# Altium project FPGA_Modular_DevBoard.PrjPcb (part 2 of 2)

## Sheet seven_segment_displays.SchDoc
size A3; SheetNumber: 12; SheetTotal: 18; SPICEModelCacheAGOJJZQO: <root> / <DocumentId>AGOJJZQO</DocumentId> / </root>
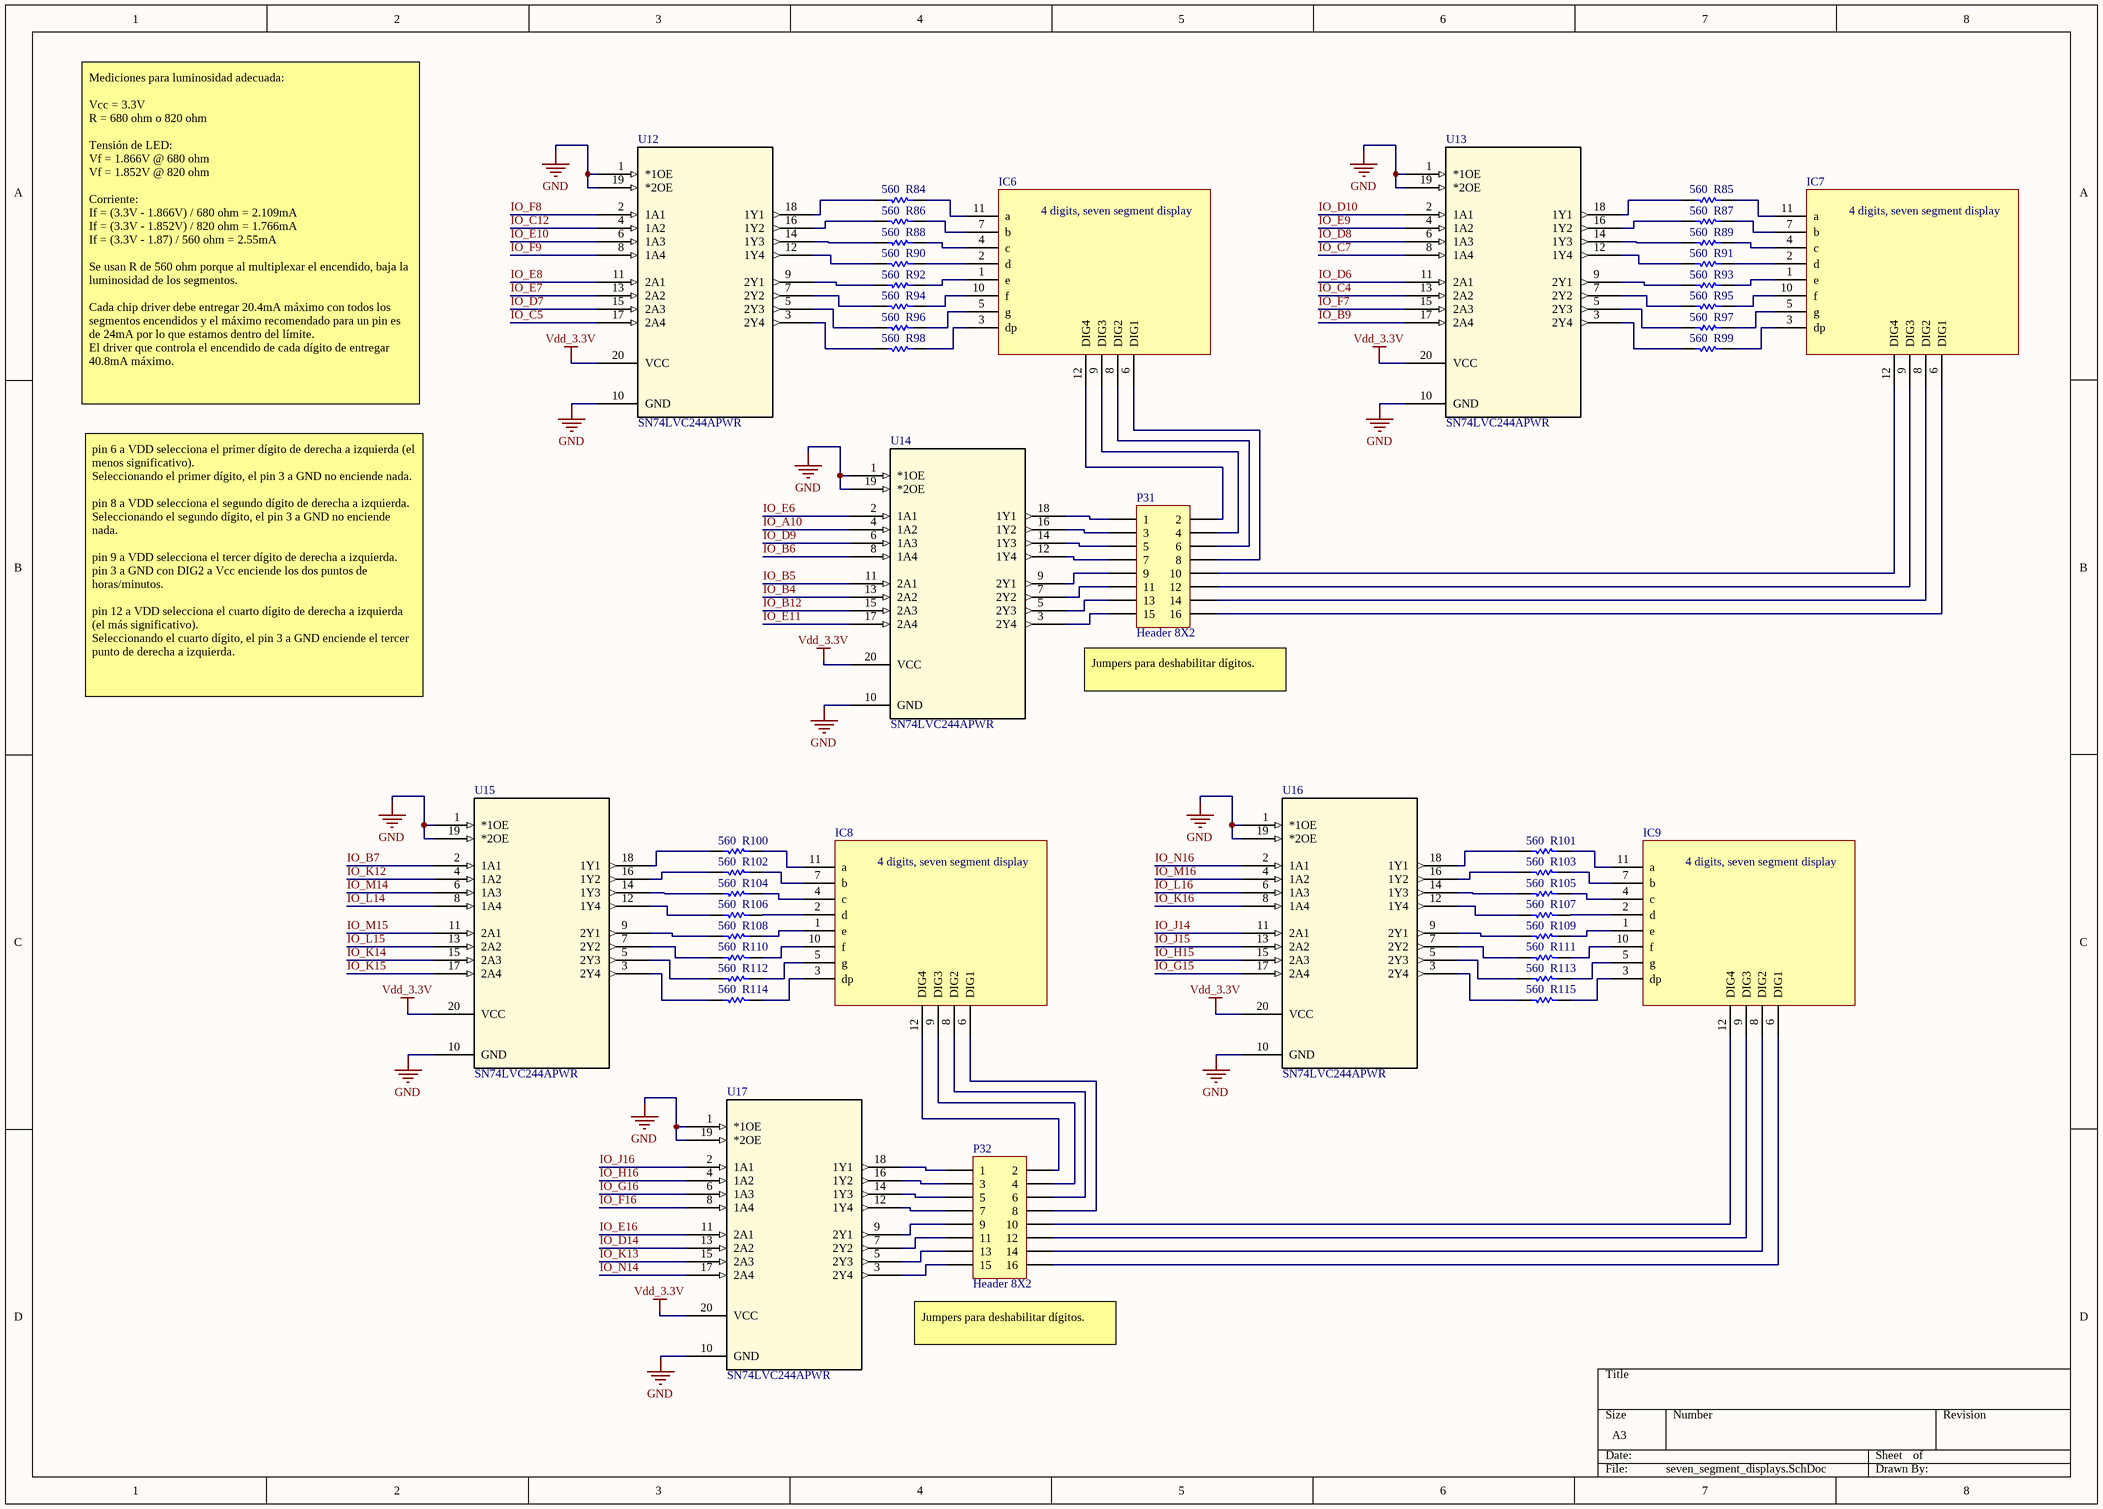
[diagram p14: seven_segment_displays.SchDoc]

### Parts
IC6  Seven segment display x 4 digits  [4 digit, seven segment display / 50.3mm x 19mm]  (value not drawn)
IC7  Seven segment display x 4 digits  [4 digit, seven segment display / 50.3mm x 19mm]  (value not drawn)
IC8  Seven segment display x 4 digits  [4 digit, seven segment display / 50.3mm x 19mm]  (value not drawn)
IC9  Seven segment display x 4 digits  [4 digit, seven segment display / 50.3mm x 19mm]  (value not drawn)
P31  Header 8X2  [HDR2X8]
P32  Header 8X2  [HDR2X8]
R84  value 560  [resistor 0603]  (hidden comment: resistor)
R85  value 560  [resistor 0603]  (hidden comment: resistor)
R86  value 560  [resistor 0603]  (hidden comment: resistor)
R87  value 560  [resistor 0603]  (hidden comment: resistor)
R88  value 560  [resistor 0603]  (hidden comment: resistor)
R89  value 560  [resistor 0603]  (hidden comment: resistor)
R90  value 560  [resistor 0603]  (hidden comment: resistor)
R91  value 560  [resistor 0603]  (hidden comment: resistor)
R92  value 560  [resistor 0603]  (hidden comment: resistor)
R93  value 560  [resistor 0603]  (hidden comment: resistor)
R94  value 560  [resistor 0603]  (hidden comment: resistor)
R95  value 560  [resistor 0603]  (hidden comment: resistor)
R96  value 560  [resistor 0603]  (hidden comment: resistor)
R97  value 560  [resistor 0603]  (hidden comment: resistor)
R98  value 560  [resistor 0603]  (hidden comment: resistor)
R99  value 560  [resistor 0603]  (hidden comment: resistor)
R100  value 560  [resistor 0603]  (hidden comment: resistor)
R101  value 560  [resistor 0603]  (hidden comment: resistor)
R102  value 560  [resistor 0603]  (hidden comment: resistor)
R103  value 560  [resistor 0603]  (hidden comment: resistor)
R104  value 560  [resistor 0603]  (hidden comment: resistor)
R105  value 560  [resistor 0603]  (hidden comment: resistor)
R106  value 560  [resistor 0603]  (hidden comment: resistor)
R107  value 560  [resistor 0603]  (hidden comment: resistor)
R108  value 560  [resistor 0603]  (hidden comment: resistor)
R109  value 560  [resistor 0603]  (hidden comment: resistor)
R110  value 560  [resistor 0603]  (hidden comment: resistor)
R111  value 560  [resistor 0603]  (hidden comment: resistor)
R112  value 560  [resistor 0603]  (hidden comment: resistor)
R113  value 560  [resistor 0603]  (hidden comment: resistor)
R114  value 560  [resistor 0603]  (hidden comment: resistor)
R115  value 560  [resistor 0603]  (hidden comment: resistor)
U12  SN74LVC244APWR  [PW20]
U13  SN74LVC244APWR  [PW20]
U14  SN74LVC244APWR  [PW20]
U15  SN74LVC244APWR  [PW20]
U16  SN74LVC244APWR  [PW20]
U17  SN74LVC244APWR  [PW20]

### Nets
GND: U12.1(*1OE) U12.10(GND) U12.19(*2OE) U13.1(*1OE) U13.10(GND) U13.19(*2OE) U14.1(*1OE) U14.10(GND) U14.19(*2OE) U15.1(*1OE) U15.10(GND) U15.19(*2OE) U16.1(*1OE) U16.10(GND) U16.19(*2OE) U17.1(*1OE) U17.10(GND) U17.19(*2OE)
Vdd_3.3V: U12.20(VCC) U13.20(VCC) U14.20(VCC) U15.20(VCC) U16.20(VCC) U17.20(VCC)
IO_A10: U14.4(1A2)
IO_B4: U14.13(2A2)
IO_B5: U14.11(2A1)
IO_B6: U14.8(1A4)
IO_B7: U15.2(1A1)
IO_B9: U13.17(2A4)
IO_B12: U14.15(2A3)
IO_C4: U13.13(2A2)
IO_C5: U12.17(2A4)
IO_C7: U13.8(1A4)
IO_C12: U12.4(1A2)
IO_D6: U13.11(2A1)
IO_D7: U12.15(2A3)
IO_D8: U13.6(1A3)
IO_D9: U14.6(1A3)
IO_D10: U13.2(1A1)
IO_D14: U17.13(2A2)
IO_E6: U14.2(1A1)
IO_E7: U12.13(2A2)
IO_E8: U12.11(2A1)
IO_E9: U13.4(1A2)
IO_E10: U12.6(1A3)
IO_E11: U14.17(2A4)
IO_E16: U17.11(2A1)
IO_F7: U13.15(2A3)
IO_F8: U12.2(1A1)
IO_F9: U12.8(1A4)
IO_F16: U17.8(1A4)
IO_G15: U16.17(2A4)
IO_G16: U17.6(1A3)
IO_H15: U16.15(2A3)
IO_H16: U17.4(1A2)
IO_J14: U16.11(2A1)
IO_J15: U16.13(2A2)
IO_J16: U17.2(1A1)
IO_K12: U15.4(1A2)
IO_K13: U17.15(2A3)
IO_K14: U15.15(2A3)
IO_K15: U15.17(2A4)
IO_K16: U16.8(1A4)
IO_L14: U15.8(1A4)
IO_L15: U15.13(2A2)
IO_L16: U16.6(1A3)
IO_M14: U15.6(1A3)
IO_M15: U15.11(2A1)
IO_M16: U16.4(1A2)
IO_N14: U17.17(2A4)
IO_N16: U16.2(1A1)
NetIC6_1: IC6.1(e) R92.2
NetIC6_2: IC6.2(d) R90.2
NetIC6_3: IC6.3(dp) R98.2
NetIC6_4: IC6.4(c) R88.2
NetIC6_5: IC6.5(g) R96.2
NetIC6_6: IC6.6(DIG1) P31.8
NetIC6_7: IC6.7(b) R86.2
NetIC6_8: IC6.8(DIG2) P31.6
NetIC6_9: IC6.9(DIG3) P31.4
NetIC6_10: IC6.10(f) R94.2
NetIC6_11: IC6.11(a) R84.2
NetIC6_12: IC6.12(DIG4) P31.2
NetIC7_1: IC7.1(e) R93.2
NetIC7_2: IC7.2(d) R91.2
NetIC7_3: IC7.3(dp) R99.2
NetIC7_4: IC7.4(c) R89.2
NetIC7_5: IC7.5(g) R97.2
NetIC7_6: IC7.6(DIG1) P31.16
NetIC7_7: IC7.7(b) R87.2
NetIC7_8: IC7.8(DIG2) P31.14
NetIC7_9: IC7.9(DIG3) P31.12
NetIC7_10: IC7.10(f) R95.2
NetIC7_11: IC7.11(a) R85.2
NetIC7_12: IC7.12(DIG4) P31.10
NetIC8_1: IC8.1(e) R108.2
NetIC8_2: IC8.2(d) R106.2
NetIC8_3: IC8.3(dp) R114.2
NetIC8_4: IC8.4(c) R104.2
NetIC8_5: IC8.5(g) R112.2
NetIC8_6: IC8.6(DIG1) P32.8
NetIC8_7: IC8.7(b) R102.2
NetIC8_8: IC8.8(DIG2) P32.6
NetIC8_9: IC8.9(DIG3) P32.4
NetIC8_10: IC8.10(f) R110.2
NetIC8_11: IC8.11(a) R100.2
NetIC8_12: IC8.12(DIG4) P32.2
NetIC9_1: IC9.1(e) R109.2
NetIC9_2: IC9.2(d) R107.2
NetIC9_3: IC9.3(dp) R115.2
NetIC9_4: IC9.4(c) R105.2
NetIC9_5: IC9.5(g) R113.2
NetIC9_6: IC9.6(DIG1) P32.16
NetIC9_7: IC9.7(b) R103.2
NetIC9_8: IC9.8(DIG2) P32.14
NetIC9_9: IC9.9(DIG3) P32.12
NetIC9_10: IC9.10(f) R111.2
NetIC9_11: IC9.11(a) R101.2
NetIC9_12: IC9.12(DIG4) P32.10
NetP31_1: P31.1 U14.18(1Y1)
NetP31_3: P31.3 U14.16(1Y2)
NetP31_5: P31.5 U14.14(1Y3)
NetP31_7: P31.7 U14.12(1Y4)
NetP31_9: P31.9 U14.9(2Y1)
NetP31_11: P31.11 U14.7(2Y2)
NetP31_13: P31.13 U14.5(2Y3)
NetP31_15: P31.15 U14.3(2Y4)
NetP32_1: P32.1 U17.18(1Y1)
NetP32_3: P32.3 U17.16(1Y2)
NetP32_5: P32.5 U17.14(1Y3)
NetP32_7: P32.7 U17.12(1Y4)
NetP32_9: P32.9 U17.9(2Y1)
NetP32_11: P32.11 U17.7(2Y2)
NetP32_13: P32.13 U17.5(2Y3)
NetP32_15: P32.15 U17.3(2Y4)
NetR84_1: R84.1 U12.18(1Y1)
NetR85_1: R85.1 U13.18(1Y1)
NetR86_1: R86.1 U12.16(1Y2)
NetR87_1: R87.1 U13.16(1Y2)
NetR88_1: R88.1 U12.14(1Y3)
NetR89_1: R89.1 U13.14(1Y3)
NetR90_1: R90.1 U12.12(1Y4)
NetR91_1: R91.1 U13.12(1Y4)
NetR92_1: R92.1 U12.9(2Y1)
NetR93_1: R93.1 U13.9(2Y1)
NetR94_1: R94.1 U12.7(2Y2)
NetR95_1: R95.1 U13.7(2Y2)
NetR96_1: R96.1 U12.5(2Y3)
NetR97_1: R97.1 U13.5(2Y3)
NetR98_1: R98.1 U12.3(2Y4)
NetR99_1: R99.1 U13.3(2Y4)
NetR100_1: R100.1 U15.18(1Y1)
NetR101_1: R101.1 U16.18(1Y1)
NetR102_1: R102.1 U15.16(1Y2)
NetR103_1: R103.1 U16.16(1Y2)
NetR104_1: R104.1 U15.14(1Y3)
NetR105_1: R105.1 U16.14(1Y3)
NetR106_1: R106.1 U15.12(1Y4)
NetR107_1: R107.1 U16.12(1Y4)
NetR108_1: R108.1 U15.9(2Y1)
NetR109_1: R109.1 U16.9(2Y1)
NetR110_1: R110.1 U15.7(2Y2)
NetR111_1: R111.1 U16.7(2Y2)
NetR112_1: R112.1 U15.5(2Y3)
NetR113_1: R113.1 U16.5(2Y3)
NetR114_1: R114.1 U15.3(2Y4)
NetR115_1: R115.1 U16.3(2Y4)

### Notes on the sheet
- Mediciones para luminosidad adecuada:
  Vcc = 3.3V
  R = 680 ohm o 820 ohm
  Tensión de LED:
  Vf = 1.866V @ 680 ohm
  Vf = 1.852V @ 820 ohm
  Corriente:
  If = (3.3V - 1.866V) / 680 ohm = 2.109mA
  If = (3.3V - 1.852V) / 820 ohm = 1.766mA
  If = (3.3V - 1.87) / 560 ohm = 2.55mA
  Se usan R de 560 ohm porque al multiplexar el encendido, baja la luminosidad de los segmentos.
  Cada chip driver debe entregar 20.4mA máximo con todos los segmentos encendidos y el máximo recomendado para un pin es de 24mA por lo que estamos dentro del límite.
  El driver que controla el encendido de cada dígito de entregar 40.8mA máximo.
- pin 6 a VDD selecciona el primer dígito de derecha a izquierda (el menos significativo).
  Seleccionando el primer dígito, el pin 3 a GND no enciende nada.
  pin 8 a VDD selecciona el segundo dígito de derecha a izquierda.
  Seleccionando el segundo dígito, el pin 3 a GND no enciende nada.
  pin 9 a VDD selecciona el tercer dígito de derecha a izquierda.
  pin 3 a GND con DIG2 a Vcc enciende los dos puntos de horas/minutos.
  pin 12 a VDD selecciona el cuarto dígito de derecha a izquierda (el más significativo).
  Seleccionando el cuarto dígito, el pin 3 a GND enciende el tercer punto de derecha a izquierda.
- (near P31) Jumpers para deshabilitar dígitos.
- Jumpers para deshabilitar dígitos.
- (in symbol Seven segment display x 4 digits) 4 digits, seven segment display

### Library data of the parts
IC6-IC9 = Seven segment display x 4 digits: Seven segment display x 4 digits with 4 decimal points and hours/minutes divider.
P31 P32 = Header 8X2: Header, 8-Pin, Dual row; LatestRevisionDate: 17-Jul-2002; LatestRevisionNote: Re-released for DXP Platform.; Publisher: Altium Limited
U12-U17 = SN74LVC244APWR: 8-ch, 1.65-V to 3.6-V buffers with 3-state outputs 20-TSSOP -40 to 125; Manufacturer_Name: Texas Instruments; Copyright: Copyright (C) 2026 Ultra Librarian. All rights reserved.; Manufacturer_Part_Number: SN74LVC244APWR; Datasheet: https://www.ti.com/lit/gpn/sn74lvc244a; RefDes: RefDes; Type: Type
R84-R115 = resistor: Package: 0603

## Nets that join several sheets
GND: power_supply (15 pins), FPGA_J3_J4 (13 pins), FPGA_J6_J8 (28 pins), FPGA_breadboard_connections (8 pins), stm32h750 (9 pins), stm32f411 (6 pins), SRAM (7 pins), Parallel_NOR_FLASH (6 pins), NOR_flash (6 pins), USB_TTL_converter (P34.4), buzzer (C76.1 C77.2 Q1.3 R117.2), micro_sd (5 pins), LEDs (44 pins), buttons_switches (16 pins), seven_segment_displays (18 pins)
Vdd_3.3V: power_supply (C6.1 C7.1 M2.4 R2.2), FPGA_J6_J8 (15 pins), FPGA_breadboard_connections (P16.14 P17.14 P20.10 P21.14), SRAM (10 pins), Parallel_NOR_FLASH (9 pins), NOR_flash (10 pins), micro_sd (C90.2 C91.2 S33.4 SJ1.1), LEDs (U8.20 U9.20 U10.20 U11.20), buttons_switches (32 pins), seven_segment_displays (6 pins)
Vdd_5V: power_supply (C1.1 C2.1 M1.4 R1.2), FPGA_breadboard_connections (P16.13 P17.13 P20.9 P21.13), stm32h750 (7 pins), stm32f411 (6 pins), buzzer (C76.2 C77.1 LS1.1)
-STM32F411_NOR_FLASH_~{CE}: stm32f411 (M6.1 P?#5.2), NOR_flash (P?#14.1 P?#17.1)
-STM32F411_NOR_FLASH_~{WP}: stm32f411 (M6.5 P?#5.10), NOR_flash (P?#14.3 P?#17.3)
-STM32F411_SPI_MISO: stm32f411 (M6.3 P?#5.6), NOR_flash (P?#14.2 P?#17.2)
-STM32F411_SPI_MOSI: stm32f411 (M6.4 P?#5.8), NOR_flash (P?#14.4 P?#17.4)
-STM32F411_SPI_SCK: stm32f411 (M6.2 P?#5.4), NOR_flash (P?#14.5 P?#17.5)
FPGA_buzzer: FPGA_J6_J8 (M?.J8_4), buzzer (P33.5)
IO_A3: FPGA_J3_J4 (M4.J3_40), FPGA_breadboard_connections (P20.8), SRAM (P?#7.28)
IO_A4: FPGA_J3_J4 (M4.J3_38), FPGA_breadboard_connections (P20.7), SRAM (P?#7.27)
IO_A5: FPGA_J3_J4 (M4.J3_36), FPGA_breadboard_connections (P20.6), SRAM (P?#7.25)
IO_A10: FPGA_J3_J4 (M4.J3_27), FPGA_breadboard_connections (P18.10), SRAM (P?#7.18), seven_segment_displays (U14.4)
IO_B4: FPGA_J3_J4 (M4.J3_37), FPGA_breadboard_connections (P18.14), SRAM (P?#7.26), seven_segment_displays (U14.13)
IO_B5: FPGA_J3_J4 (M4.J3_35), FPGA_breadboard_connections (P18.13), SRAM (P?#7.24), seven_segment_displays (U14.11)
IO_B6: FPGA_J3_J4 (M4.J3_33), FPGA_breadboard_connections (P18.12), SRAM (P?#7.22), seven_segment_displays (U14.8)
IO_B7: FPGA_J3_J4 (M4.J3_34), FPGA_breadboard_connections (P20.5), SRAM (P?#7.23), seven_segment_displays (U15.2)
IO_B9: FPGA_J3_J4 (M4.J3_30), FPGA_breadboard_connections (P20.4), SRAM (P?#7.21), seven_segment_displays (U13.17)
IO_B12: FPGA_J3_J4 (M4.J3_6), FPGA_breadboard_connections (P18.15), SRAM (P?#7.2), seven_segment_displays (U14.15)
IO_B16: FPGA_J3_J4 (M4.J4_40), FPGA_breadboard_connections (P16.12), SRAM (P?#7.30)
IO_C2: FPGA_J6_J8 (M?.J8_32), FPGA_breadboard_connections (P17.7), Parallel_NOR_FLASH (P?#12.26)
IO_C4: FPGA_J3_J4 (M4.J3_26), FPGA_breadboard_connections (P20.2), SRAM (P?#7.17), seven_segment_displays (U13.13)
IO_C5: FPGA_J3_J4 (M4.J3_23), FPGA_breadboard_connections (P18.8), SRAM (P?#7.14), seven_segment_displays (U12.17)
IO_C7: FPGA_J3_J4 (M4.J3_20), FPGA_breadboard_connections (P18.20), SRAM (P?#7.13), seven_segment_displays (U13.8)
IO_C12: FPGA_J3_J4 (M4.J3_7), FPGA_breadboard_connections (P18.2), SRAM (P?#7.3), seven_segment_displays (U12.4)
IO_D1: FPGA_J6_J8 (M?.J8_30), FPGA_breadboard_connections (P17.5), Parallel_NOR_FLASH (P?#12.25)
IO_D6: FPGA_J3_J4 (M4.J3_24), FPGA_breadboard_connections (P20.1), SRAM (P?#7.15), seven_segment_displays (U13.11)
IO_D7: FPGA_J3_J4 (M4.J3_19), FPGA_breadboard_connections (P18.7), SRAM (P?#7.12), seven_segment_displays (U12.15)
IO_D8: FPGA_J3_J4 (M4.J3_18), FPGA_breadboard_connections (P18.19), SRAM (P?#7.11), seven_segment_displays (U13.6)
IO_D9: FPGA_J3_J4 (M4.J3_29), FPGA_breadboard_connections (P18.11), SRAM (P?#7.20), seven_segment_displays (U14.6)
IO_D10: FPGA_J3_J4 (M4.J3_10), FPGA_breadboard_connections (P18.17), SRAM (P?#7.6), seven_segment_displays (U13.2)
IO_D14: FPGA_J3_J4 (M4.J4_37), FPGA_breadboard_connections (P14.15), Parallel_NOR_FLASH (P?#12.16), seven_segment_displays (U17.13)
IO_E1: FPGA_J6_J8 (M?.J8_28), FPGA_breadboard_connections (P17.3), Parallel_NOR_FLASH (P?#12.24)
IO_E3: FPGA_J6_J8 (M?.J8_37), FPGA_breadboard_connections (P17.8), Parallel_NOR_FLASH (P?#12.29)
IO_E6: FPGA_J3_J4 (M4.J3_25), FPGA_breadboard_connections (P18.9), SRAM (P?#7.16), seven_segment_displays (U14.2)
IO_E7: FPGA_J3_J4 (M4.J3_17), FPGA_breadboard_connections (P18.6), SRAM (P?#7.10), seven_segment_displays (U12.13)
IO_E8: FPGA_J3_J4 (M4.J3_15), FPGA_breadboard_connections (P18.5), SRAM (P?#7.8), seven_segment_displays (U12.11)
IO_E9: FPGA_J3_J4 (M4.J3_16), FPGA_breadboard_connections (P18.18), SRAM (P?#7.9), seven_segment_displays (U13.4)
IO_E10: FPGA_J3_J4 (M4.J3_9), FPGA_breadboard_connections (P18.3), SRAM (P?#7.5), seven_segment_displays (U12.6)
IO_E11: FPGA_J3_J4 (M4.J3_8), FPGA_breadboard_connections (P18.16), SRAM (P?#7.4), seven_segment_displays (U14.17)
IO_E15: FPGA_J3_J4 (M4.J4_30), FPGA_breadboard_connections (P16.8), micro_sd (P?#21.1)
IO_E16: FPGA_J3_J4 (M4.J4_33), FPGA_breadboard_connections (P14.13), Parallel_NOR_FLASH (P?#12.14), seven_segment_displays (U17.11)
IO_F1: FPGA_J6_J8 (M?.J8_26), FPGA_breadboard_connections (P17.1), Parallel_NOR_FLASH (P?#12.23)
IO_F3: FPGA_J6_J8 (M?.J8_38), FPGA_breadboard_connections (P17.12), Parallel_NOR_FLASH (P?#12.28)
IO_F5: FPGA_J6_J8 (M?.J8_39), FPGA_breadboard_connections (P17.10), Parallel_NOR_FLASH (P?#12.30)
IO_F7: FPGA_J3_J4 (M4.J3_28), FPGA_breadboard_connections (P20.3), SRAM (P?#7.19), seven_segment_displays (U13.15)
IO_F8: FPGA_J3_J4 (M4.J3_5), FPGA_breadboard_connections (P18.1), SRAM (P?#7.1), seven_segment_displays (U12.2)
IO_F9: FPGA_J3_J4 (M4.J3_13), FPGA_breadboard_connections (P18.4), SRAM (P?#7.7), seven_segment_displays (U12.8)
IO_F15: FPGA_J3_J4 (M4.J4_28), FPGA_breadboard_connections (P16.7), micro_sd (P?#21.3)
IO_F16: FPGA_breadboard_connections (P14.12), seven_segment_displays (U17.8)
IO_G1: FPGA_J6_J8 (M?.J8_24), FPGA_breadboard_connections (P15.18), Parallel_NOR_FLASH (P?#12.22)
IO_G2: FPGA_J6_J8 (M?.J8_23), FPGA_breadboard_connections (P15.17), micro_sd (P?#21.2)
IO_G3: FPGA_J6_J8 (M?.J8_34), FPGA_breadboard_connections (P17.9), Parallel_NOR_FLASH (P?#12.27)
IO_G14: FPGA_J3_J4 (M4.J4_39), FPGA_breadboard_connections (P14.16), SRAM (P?#7.29)
IO_G15: FPGA_J3_J4 (M4.J4_26), FPGA_breadboard_connections (P16.6), micro_sd (P?#21.5), seven_segment_displays (U16.17)
IO_G16: FPGA_J3_J4 (M4.J4_27), FPGA_breadboard_connections (P14.11), Parallel_NOR_FLASH (P?#12.10), seven_segment_displays (U17.6)
IO_H1: FPGA_J6_J8 (M?.J8_20), FPGA_breadboard_connections (P15.16), Parallel_NOR_FLASH (P?#12.21)
IO_H3: FPGA_J6_J8 (M?.J8_18), FPGA_breadboard_connections (P15.14), Parallel_NOR_FLASH (P?#12.20)
IO_H15: FPGA_J3_J4 (M4.J4_24), FPGA_breadboard_connections (P16.5), Parallel_NOR_FLASH (P?#12.2), seven_segment_displays (U16.15)
IO_H16: FPGA_J3_J4 (M4.J4_25), FPGA_breadboard_connections (P14.10), Parallel_NOR_FLASH (P?#12.8), seven_segment_displays (U17.4)
IO_J2: FPGA_J6_J8 (M?.J8_16), FPGA_breadboard_connections (P15.12), Parallel_NOR_FLASH (P?#12.19)
IO_J14: FPGA_J3_J4 (M4.J4_18), FPGA_breadboard_connections (P16.3), Parallel_NOR_FLASH (P?#12.11), seven_segment_displays (U16.11)
IO_J15: FPGA_J3_J4 (M4.J4_20), FPGA_breadboard_connections (P16.4), Parallel_NOR_FLASH (P?#12.4), seven_segment_displays (U16.13)
IO_J16: FPGA_J3_J4 (M4.J4_23), FPGA_breadboard_connections (P14.9), Parallel_NOR_FLASH (P?#12.6), seven_segment_displays (U17.2)
IO_JF16: FPGA_J3_J4 (M4.J4_29), Parallel_NOR_FLASH (P?#12.12)
IO_K12: FPGA_breadboard_connections (P14.1), seven_segment_displays (U15.4)
IO_K13: FPGA_J3_J4 (M4.J4_4), FPGA_breadboard_connections (P14.17), Parallel_NOR_FLASH (P?#12.5), seven_segment_displays (U17.15)
IO_K14: FPGA_J3_J4 (M4.J4_15), FPGA_breadboard_connections (P14.6), Parallel_NOR_FLASH (P?#12.15), seven_segment_displays (U15.15)
IO_K15: FPGA_J3_J4 (M4.J4_17), FPGA_breadboard_connections (P14.7), Parallel_NOR_FLASH (P?#12.13), seven_segment_displays (U15.17)
IO_K16: FPGA_breadboard_connections (P16.2), seven_segment_displays (U16.8)
IO_L1: FPGA_J6_J8 (M?.J8_8), FPGA_breadboard_connections (P15.6), Parallel_NOR_FLASH (P?#12.17)
IO_L5: FPGA_J6_J8 (M?.J8_10), FPGA_breadboard_connections (P15.8), Parallel_NOR_FLASH (P?#12.18)
IO_L7: FPGA_J6_J8 (P?#2.2), FPGA_breadboard_connections (P21.5)
IO_L8: FPGA_J6_J8 (M4.J6_24), FPGA_breadboard_connections (P19.18), Parallel_NOR_FLASH (P?#12.3)
IO_L14: FPGA_breadboard_connections (P14.3), seven_segment_displays (U15.8)
IO_L15: FPGA_breadboard_connections (P14.5), seven_segment_displays (U15.13)
IO_L16: FPGA_breadboard_connections (P16.1), seven_segment_displays (U16.6)
IO_M6: FPGA_J6_J8 (M4.J6_26), FPGA_breadboard_connections (P19.20), Parallel_NOR_FLASH (P?#12.1)
IO_M14: FPGA_breadboard_connections (P14.2), seven_segment_displays (U15.6)
IO_M15: FPGA_breadboard_connections (P14.4), seven_segment_displays (U15.11)
IO_M16: FPGA_J3_J4 (M4.J4_10), FPGA_breadboard_connections (P14.20), Parallel_NOR_FLASH (P?#12.9), seven_segment_displays (U16.4)
IO_N6: FPGA_J6_J8 (P?#2.3), FPGA_breadboard_connections (P21.7)
IO_N14: FPGA_J3_J4 (M4.J4_6), FPGA_breadboard_connections (P14.18), Parallel_NOR_FLASH (P?#12.7), seven_segment_displays (U17.17)
IO_N16: FPGA_breadboard_connections (P14.19), seven_segment_displays (U16.2)
IO_P7: FPGA_J6_J8 (P?#2.1), FPGA_breadboard_connections (P21.3)
IO_R4: FPGA_J6_J8 (P?#2.4), FPGA_breadboard_connections (P21.9)
IO_R8: FPGA_J6_J8 (M4.J6_28), FPGA_breadboard_connections (P21.2), micro_sd (P?#21.4)
IO_T3: FPGA_J6_J8 (P?#2.5), FPGA_breadboard_connections (P21.11)
IO_T12: FPGA_J6_J8 (M4.J6_3), FPGA_breadboard_connections (P19.1)
L_GPLLT_IN: FPGA_J6_J8 (7 pins), FPGA_breadboard_connections (P15.20)
LCD_BACKLIGHT_PWM: stm32h750 (M5.J2_20 P?#4.17), Parallel_NOR_FLASH (P?#11.3)
NOR_FLASH_1_~{CE}: FPGA_J6_J8 (M4.J6_8), NOR_flash (P?#16.1)
NOR_FLASH_1_CLK: FPGA_J6_J8 (M4.J6_18), NOR_flash (P?#16.5)
NOR_FLASH_1_DI: FPGA_J6_J8 (M4.J6_16), NOR_flash (P?#16.4)
NOR_FLASH_1_DO: FPGA_J6_J8 (M4.J6_10), NOR_flash (P?#16.2)
NOR_FLASH_1_~{WP}: FPGA_J6_J8 (M4.J6_14), NOR_flash (P?#16.3)
NOR_FLASH_2_~{CE}: FPGA_J6_J8 (M4.J6_7 P?#3.1), NOR_flash (P?#19.1)
NOR_FLASH_2_CLK: FPGA_J6_J8 (M4.J6_19 P?#3.5), NOR_flash (P?#19.5)
NOR_FLASH_2_DI: FPGA_J6_J8 (M4.J6_15 P?#3.4), NOR_flash (P?#19.4)
NOR_FLASH_2_DO: FPGA_J6_J8 (M4.J6_9 P?#3.2), NOR_flash (P?#19.2)
NOR_FLASH_2_~{WP}: FPGA_J6_J8 (M4.J6_13 P?#3.3), NOR_flash (P?#19.3)
PCLKT1_0: FPGA_J3_J4 (M4.J4_19), FPGA_J6_J8 (6 pins), FPGA_breadboard_connections (P14.8)
PCLKT2_0: FPGA_J6_J8 (7 pins), FPGA_breadboard_connections (P21.6)
PCLKT2_1: FPGA_J6_J8 (7 pins), FPGA_breadboard_connections (P19.13)
PCLKT3_0: FPGA_J6_J8 (7 pins), FPGA_breadboard_connections (P15.5)
PCLKT4_0: FPGA_J6_J8 (7 pins), FPGA_breadboard_connections (P15.10)
R_GPLLT_IN: FPGA_J3_J4 (M4.J4_35), FPGA_J6_J8 (6 pins), FPGA_breadboard_connections (P14.14)
STM32F411_buzzer: stm32f411 (M6.36), buzzer (P33.1)
STM32F411_NOR_FLASH_~{CE}: FPGA_J6_J8 (M?.J8_3), stm32f411 (P?#5.1)
STM32F411_NOR_FLASH_~{WP}: FPGA_J6_J8 (M?.J8_13), stm32f411 (P?#5.9)
STM32F411_PA0: stm32f411 (M6.26), Parallel_NOR_FLASH (P?#11.27)
STM32F411_PA1: stm32f411 (M6.27), Parallel_NOR_FLASH (P?#11.26)
STM32F411_PA2: stm32f411 (M6.28), Parallel_NOR_FLASH (P?#11.25)
STM32F411_PA3: stm32f411 (M6.29), Parallel_NOR_FLASH (P?#11.24)
STM32F411_PA4: stm32f411 (M6.30), Parallel_NOR_FLASH (P?#11.23)
STM32F411_PA5: stm32f411 (M6.31), Parallel_NOR_FLASH (P?#11.22)
STM32F411_PA6: stm32f411 (M6.32), Parallel_NOR_FLASH (P?#11.21)
STM32F411_PA7: stm32f411 (M6.33), Parallel_NOR_FLASH (P?#11.20)
STM32F411_PA9: FPGA_J6_J8 (M?.J8_15), stm32f411 (M6.6)
STM32F411_PA10: FPGA_J6_J8 (M?.J8_17), stm32f411 (M6.7)
STM32F411_PA15: FPGA_J6_J8 (M?.J8_19), stm32f411 (M6.10)
STM32F411_PB0: stm32f411 (M6.34), Parallel_NOR_FLASH (P?#11.19)
STM32F411_PB1: stm32f411 (M6.35), Parallel_NOR_FLASH (P?#11.18)
STM32F411_PB5: FPGA_J6_J8 (M?.J8_25), stm32f411 (M6.13)
STM32F411_PB6: FPGA_J6_J8 (M?.J8_29), stm32f411 (M6.14)
STM32F411_PB7: FPGA_J6_J8 (M?.J8_33), stm32f411 (M6.15)
STM32F411_PB8: FPGA_J6_J8 (M?.J8_35), stm32f411 (M6.16)
STM32F411_PB9: FPGA_J6_J8 (M?.J8_36), stm32f411 (M6.17)
STM32F411_PB10: stm32f411 (M6.37), Parallel_NOR_FLASH (P?#11.17)
STM32F411_PC13: stm32f411 (M6.22), Parallel_NOR_FLASH (P?#11.30)
STM32F411_PC14: stm32f411 (M6.23), Parallel_NOR_FLASH (P?#11.29)
STM32F411_PC15: stm32f411 (M6.24), Parallel_NOR_FLASH (P?#11.28)
STM32F411_SPI_MISO: FPGA_J6_J8 (M?.J8_5), stm32f411 (P?#5.5)
STM32F411_SPI_MOSI: FPGA_J6_J8 (M?.J8_9), stm32f411 (P?#5.7)
STM32F411_SPI_SCK: FPGA_J6_J8 (M?.J8_6), stm32f411 (P?#5.3)
STM32H750_buzzer: stm32h750 (M5.J3_44), buzzer (P33.3)
STM32H750_LCD_B2: FPGA_J3_J4 (M4.J4_14), stm32h750 (M5.J2_33 P?#4.3)
STM32H750_LCD_B3: FPGA_J6_J8 (M4.J6_38), stm32h750 (M5.J2_10 P?#4.11), micro_sd (P?#20.2)
STM32H750_LCD_B4: stm32h750 (M5.J3_16 P?#4.14), micro_sd (P?#20.5)
STM32H750_LCD_B5: stm32h750 (M5.J3_31 P?#4.28), Parallel_NOR_FLASH (P?#11.14)
STM32H750_LCD_B6: stm32h750 (M5.J2_42 P?#4.25), Parallel_NOR_FLASH (P?#11.11)
STM32H750_LCD_B7: FPGA_J3_J4 (M4.J4_13), stm32h750 (M5.J2_41 P?#4.1)
STM32H750_LCD_CLK: stm32h750 (M5.J3_14 P?#4.16), Parallel_NOR_FLASH (P?#11.2)
STM32H750_LCD_DE: stm32h750 (M5.J3_15 P?#4.20), Parallel_NOR_FLASH (P?#11.6)
STM32H750_LCD_G2: stm32h750 (M5.J3_28 P?#4.10), micro_sd (P?#20.1)
STM32H750_LCD_G3: stm32h750 (M5.J3_17 P?#4.22), Parallel_NOR_FLASH (P?#11.8)
STM32H750_LCD_G4: stm32h750 (M5.J3_12 P?#4.18), Parallel_NOR_FLASH (P?#11.4)
STM32H750_LCD_G5: stm32h750 (M5.J3_11 P?#4.29), Parallel_NOR_FLASH (P?#11.15)
STM32H750_LCD_G6: FPGA_J6_J8 (M4.J6_29), stm32h750 (M5.J2_15 P?#4.9)
STM32H750_LCD_G7: stm32h750 (M5.J2_32 P?#4.23), Parallel_NOR_FLASH (P?#11.9)
STM32H750_LCD_HSYNC: stm32h750 (M5.J2_16 P?#4.13), micro_sd (P?#20.4)
STM32H750_LCD_R2: stm32h750 (M5.J3_33 P?#4.30), Parallel_NOR_FLASH (P?#11.16)
STM32H750_LCD_R3: stm32h750 (M5.J3_24 P?#4.12), micro_sd (P?#20.3)
STM32H750_LCD_R4: stm32h750 (M5.J3_29 P?#4.26), Parallel_NOR_FLASH (P?#11.12)
STM32H750_LCD_R5: FPGA_J3_J4 (M4.J4_38), stm32h750 (M5.J3_38 P?#4.6)
STM32H750_LCD_R6: stm32h750 (M5.J3_23 P?#4.24), Parallel_NOR_FLASH (P?#11.10)
STM32H750_LCD_R7: stm32h750 (M5.J3_13 P?#4.27), Parallel_NOR_FLASH (P?#11.13)
STM32H750_LCD_SPARE1: FPGA_J6_J8 (M4.J6_27), stm32h750 (M5.J2_17 P?#4.7)
STM32H750_LCD_SPARE2: stm32h750 (M5.J2_18 P?#4.15), Parallel_NOR_FLASH (P?#11.1)
STM32H750_LCD_SPARE3: FPGA_J3_J4 (M4.J4_3), stm32h750 (M5.J2_25 P?#4.5)
STM32H750_LCD_SPARE4: stm32h750 (M5.J2_26 P?#4.19), Parallel_NOR_FLASH (P?#11.5)
STM32H750_LCD_SPARE5: stm32h750 (M5.J2_28 P?#4.21), Parallel_NOR_FLASH (P?#11.7)
STM32H750_LCD_VSYNC: FPGA_J3_J4 (M4.J4_36), stm32h750 (M5.J3_30 P?#4.8)
STM32H750_PA0: FPGA_J6_J8 (P?#1.1), stm32h750 (M5.J3_34), SRAM (P?#8.9)
STM32H750_PA2: stm32h750 (M5.J3_32), SRAM (P?#8.10)
STM32H750_PA7: stm32h750 (M5.J3_27), SRAM (P?#8.12)
STM32H750_PA9: FPGA_J6_J8 (M4.J6_25), stm32h750 (M5.J2_19)
STM32H750_PA10: FPGA_J6_J8 (M4.J6_20), stm32h750 (M5.J2_22)
STM32H750_PA15: FPGA_J6_J8 (M4.J6_23), stm32h750 (M5.J2_23)
STM32H750_PB2: stm32h750 (M5.J3_22), SRAM (P?#8.14)
STM32H750_PB3: stm32h750 (M5.J2_35), SRAM (P?#8.30)
STM32H750_PB4: stm32h750 (M5.J2_38), SRAM (P?#8.27)
STM32H750_PB5: stm32h750 (M5.J2_37), SRAM (P?#8.28)
STM32H750_PB6: stm32h750 (M5.J2_40), SRAM (P?#8.25)
STM32H750_PB7: stm32h750 (M5.J2_39), SRAM (P?#8.26)
STM32H750_PB12: stm32h750 (M5.J3_10), SRAM (P?#8.19)
STM32H750_PB13: stm32h750 (M5.J3_9), SRAM (P?#8.20)
STM32H750_PB14: stm32h750 (M5.J3_8), SRAM (P?#8.21)
STM32H750_PB15: stm32h750 (M5.J3_7), SRAM (P?#8.22)
STM32H750_PC1: stm32h750 (M5.J3_37), SRAM (P?#8.6)
STM32H750_PC2: FPGA_J6_J8 (P?#1.2), stm32h750 (M5.J3_36), SRAM (P?#8.7)
STM32H750_PC3: stm32h750 (M5.J3_35), SRAM (P?#8.8)
STM32H750_PC4: stm32h750 (M5.J3_26), SRAM (P?#8.11)
STM32H750_PC5: stm32h750 (M5.J3_25), SRAM (P?#8.13)
STM32H750_PC13: stm32h750 (M5.J3_39), SRAM (P?#8.5)
STM32H750_PD0: FPGA_J3_J4 (M4.J4_5), stm32h750 (M5.J2_27)
STM32H750_PD1: FPGA_J3_J4 (M4.J4_8), stm32h750 (M5.J2_30)
STM32H750_PD2: FPGA_J3_J4 (M4.J4_7), stm32h750 (M5.J2_29)
STM32H750_PD4: FPGA_J3_J4 (M4.J4_9), stm32h750 (M5.J2_31)
STM32H750_PD5: FPGA_J3_J4 (M4.J4_16), stm32h750 (M5.J2_34)
STM32H750_PD7: stm32h750 (M5.J2_36), SRAM (P?#8.29)
STM32H750_PD8: FPGA_J6_J8 (M4.J6_40), stm32h750 (M5.J2_8)
STM32H750_PD9: FPGA_J6_J8 (M4.J6_39), stm32h750 (M5.J2_7)
STM32H750_PD11: FPGA_J6_J8 (M4.J6_37), stm32h750 (M5.J2_9)
STM32H750_PD12: FPGA_J6_J8 (M4.J6_36), stm32h750 (M5.J2_12)
STM32H750_PD13: FPGA_J6_J8 (M4.J6_35), stm32h750 (M5.J2_11)
STM32H750_PD14: FPGA_J6_J8 (M4.J6_30), stm32h750 (M5.J2_14)
STM32H750_PD15: FPGA_J6_J8 (M4.J6_33), stm32h750 (M5.J2_13)
STM32H750_PE0: stm32h750 (M5.J2_44), SRAM (P?#8.23)
STM32H750_PE1: stm32h750 (M5.J2_43), SRAM (P?#8.24)
STM32H750_PE3: stm32h750 (M5.J3_43), SRAM (P?#8.2)
STM32H750_PE4: FPGA_J6_J8 (P?#1.5), stm32h750 (M5.J3_42), SRAM (P?#8.1)
STM32H750_PE5: stm32h750 (M5.J3_41), SRAM (P?#8.4)
STM32H750_PE6: FPGA_J6_J8 (P?#1.4), stm32h750 (M5.J3_40), SRAM (P?#8.3)
STM32H750_PE7: stm32h750 (M5.J3_21), SRAM (P?#8.15)
STM32H750_PE8: stm32h750 (M5.J3_20), SRAM (P?#8.16)
STM32H750_PE9: stm32h750 (M5.J3_19), SRAM (P?#8.17)
STM32H750_PE10: stm32h750 (M5.J3_18), SRAM (P?#8.18)
USB_TTL_DTR: FPGA_J6_J8 (M4.J6_4), USB_TTL_converter (P34.1)
USB_TTL_RX: FPGA_J6_J8 (M4.J6_6), USB_TTL_converter (P34.2)
USB_TTL_TX: FPGA_J6_J8 (M4.J6_5), USB_TTL_converter (P34.3)